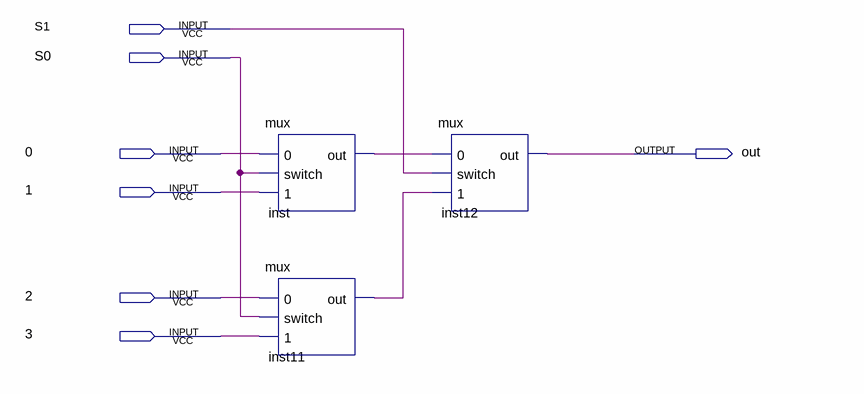
[diagram p0: schematic sheet]
// Quartus schematic mux-4.bdf as structural Verilog: 3 symbols, 7 pins
module \mux-4  (
  input  S1,
  input  S0,
  input  \0 ,
  input  \1 ,
  input  \2 ,
  input  \3 ,
  output out
);

  wire inst11_out, inst_out;

  mux inst (.\0 (\0 ), .switch(S0), .\1 (\1 ), .out(inst_out));
  mux inst11 (.\0 (\2 ), .switch(S0), .\1 (\3 ), .out(inst11_out));
  mux inst12 (.\0 (inst_out), .switch(S1), .\1 (inst11_out), .out(out));
endmodule
